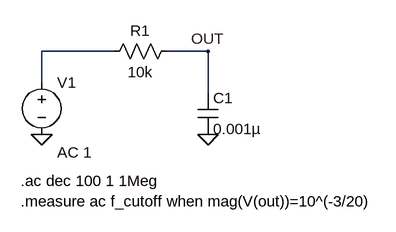
[diagram p0: schematic Exercise-8-2a_Low-pass-filter.asc]
Exercise-8-2a_Low-pass-filter.asc, the LTspice schematic file:
Version 4.1
SHEET 1 880 680
WIRE 160 64 48 64
WIRE 304 64 240 64
WIRE 48 112 48 64
WIRE 304 128 304 64
FLAG 48 192 0
FLAG 304 192 0
FLAG 304 64 OUT
SYMBOL voltage 48 96 R0
WINDOW 123 24 124 Left 2
WINDOW 39 0 0 Left 0
SYMATTR Value2 AC 1
SYMATTR InstName V1
SYMATTR Value ""
SYMBOL res 256 48 R90
WINDOW 0 0 56 VBottom 2
WINDOW 3 32 56 VTop 2
SYMATTR InstName R1
SYMATTR Value 10k
SYMBOL cap 288 128 R0
SYMATTR InstName C1
SYMATTR Value 0.001µ
TEXT 16 264 Left 2 !.ac dec 100 1 1Meg\n.measure ac f_cutoff when mag(V(out))=10^(-3/20)

The netlist it stands for:
* Exercise-8-2a_Low-pass-filter.asc
V1 N001 0 AC 1
R1 OUT N001 10k
C1 OUT 0 0.001µ
.ac dec 100 1 1Meg
.measure ac f_cutoff when mag(V(out))=10^(-3/20)
.backanno
.end

* Results of the author's LTspice run, read from the files saved beside the schematic
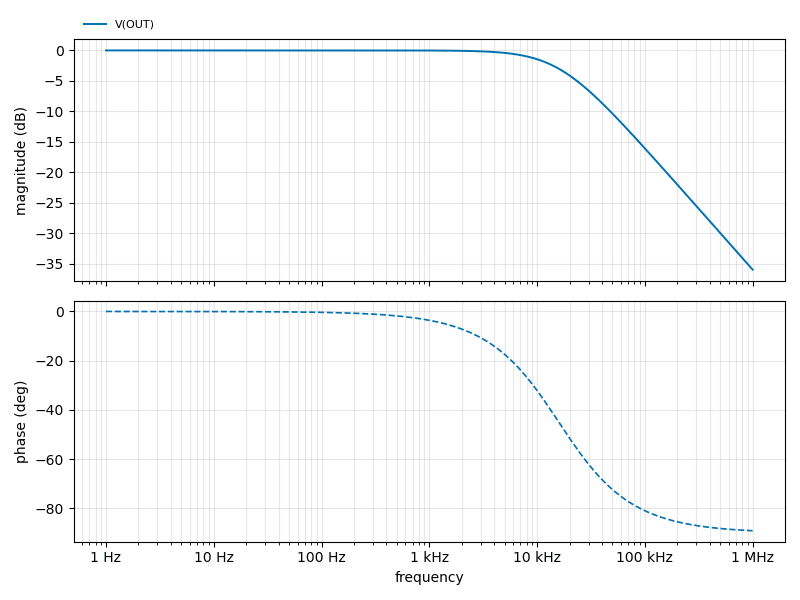
[diagram p1: AC Analysis of Exercise-8-2a_Low-pass-filter.asc, plotted from the saved traces]
* AC Analysis, 1 run:
*   V(OUT): -0.00 dB at 1 Hz, -35.96 dB at 1 MHz, peak -0.00 dB at 1 Hz, 3 dB below the peak at 15.91 kHz
* From the log:
*   Measurement "f_cutoff" FAIL'ed